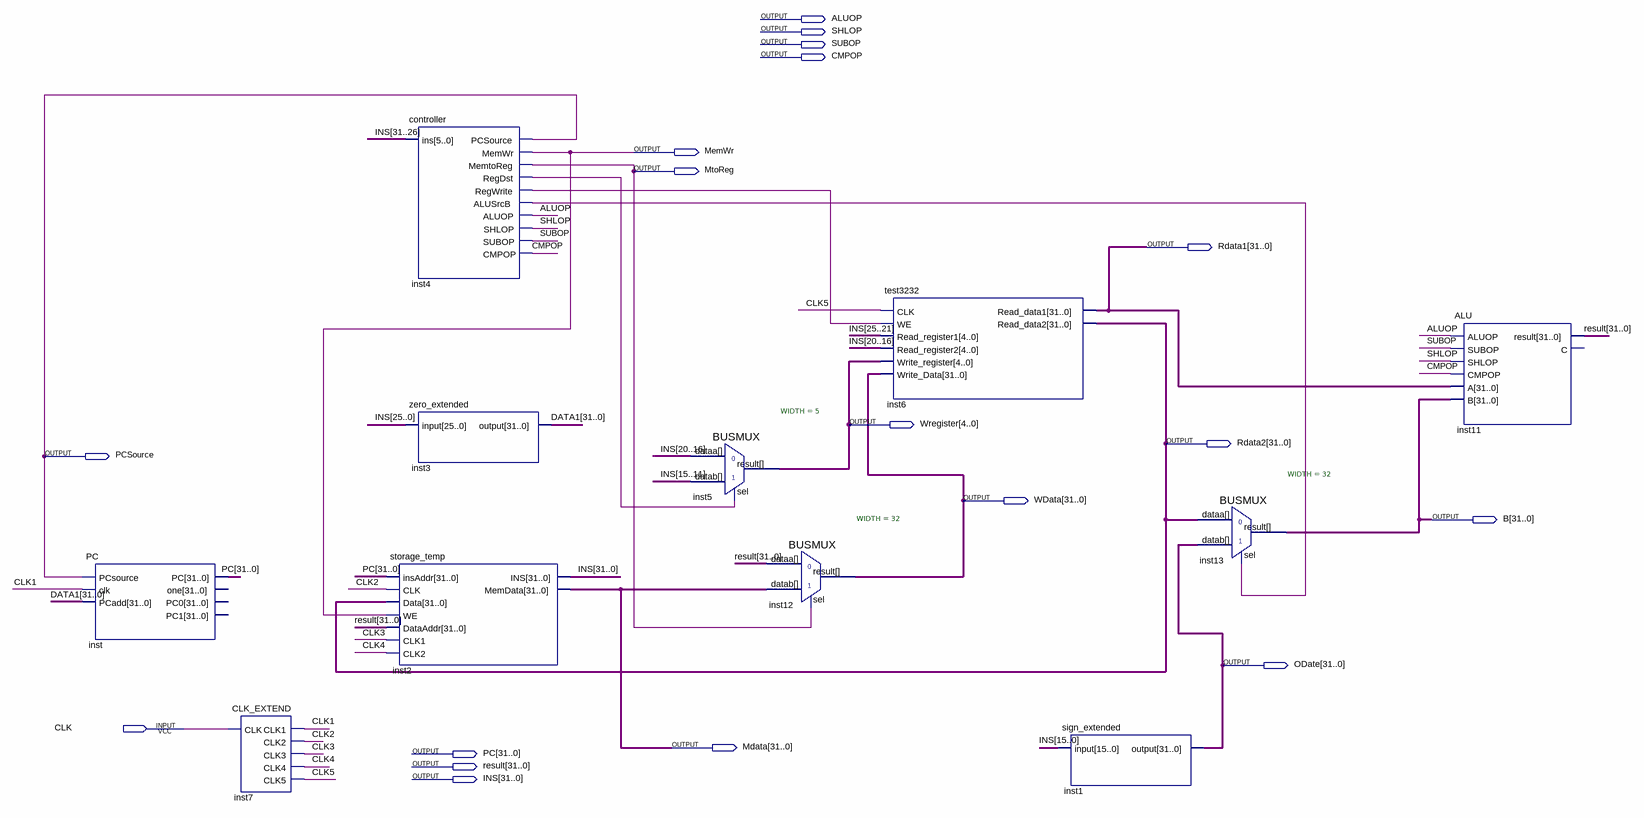
[diagram p0: schematic sheet]
// Quartus schematic CPU.bdf as structural Verilog: 11 symbols, 18 pins
module CPU (
  input  CLK,
  output ALUOP,
  output SHLOP,
  output SUBOP,
  output CMPOP,
  output MemWr,
  output MtoReg,
  output [31:0] Rdata1,
  output [4:0] Wregister,
  output [31:0] Rdata2,
  output PCSource,
  output [31:0] WData,
  output [31:0] B,
  output [31:0] ODate,
  output [31:0] Mdata,
  output [31:0] PC,
  output [31:0] result,
  output [31:0] INS
);

  wire CLK1, CLK2, CLK3, CLK4, CLK5, inst4_alusrcb, inst4_regdst, inst4_regwrite;
  wire [31:0] DATA1;

  PC inst (.PCsource(PCSource), .clk(CLK1), .PCadd(DATA1), .PC(PC));  // open: one, PC0, PC1
  CLK_EXTEND inst7 (.CLK(CLK), .CLK1(CLK1), .CLK2(CLK2), .CLK3(CLK3), .CLK4(CLK4), .CLK5(CLK5));
  storage_temp inst2 (
    .insAddr(PC), .CLK(CLK2), .Data(Rdata2), .WE(MemWr), .DataAddr(result), .CLK1(CLK3), .CLK2(CLK4),
    .INS(INS), .MemData(Mdata));
  controller inst4 (
    .ins(INS[31:26]), .PCSource(PCSource), .MemWr(MemWr), .MemtoReg(MtoReg), .RegDst(inst4_regdst),
    .RegWrite(inst4_regwrite), .ALUSrcB(inst4_alusrcb), .ALUOP(ALUOP), .SHLOP(SHLOP), .SUBOP(SUBOP),
    .CMPOP(CMPOP));
  zero_extended inst3 (.\input (INS[25:0]), .\output (DATA1));
  BUSMUX #(.WIDTH(5)) inst5 (.datab(INS[15:11]), .sel(inst4_regdst), .dataa(INS[20:16]), .result(Wregister));
  BUSMUX #(.WIDTH(32)) inst12 (.datab(Mdata), .sel(MtoReg), .dataa(result), .result(WData));
  test3232 inst6 (
    .CLK(CLK5), .WE(inst4_regwrite), .Read_register1(INS[25:21]), .Read_register2(INS[20:16]),
    .Write_register(Wregister), .Write_Data(WData), .Read_data1(Rdata1), .Read_data2(Rdata2));
  sign_extended inst1 (.\input (INS[15:0]), .\output (ODate));
  BUSMUX #(.WIDTH(32)) inst13 (.datab(ODate), .sel(inst4_alusrcb), .dataa(Rdata2), .result(B));
  ALU inst11 (
    .ALUOP(ALUOP), .SUBOP(SUBOP), .SHLOP(SHLOP), .CMPOP(CMPOP), .A(Rdata1), .B(B), .result(result));  // open: C
endmodule
